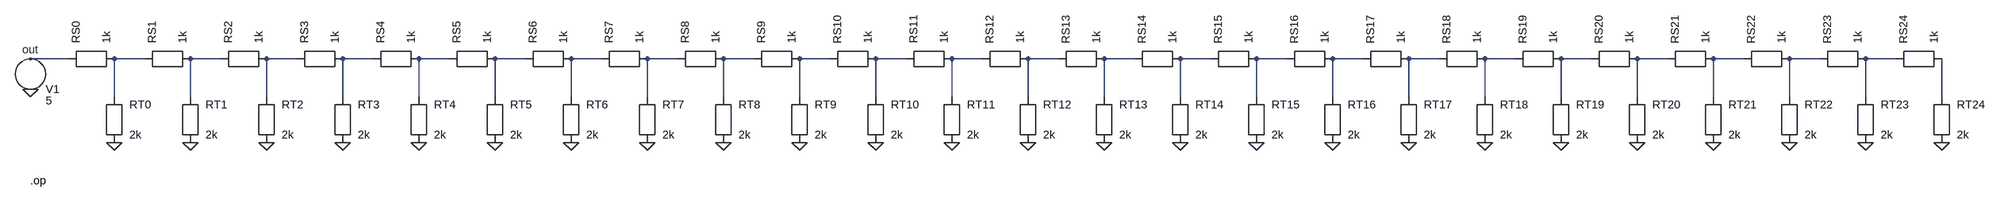
[diagram p0: schematic r2r_ladder_drawn.asc]
r2r_ladder_drawn.asc, the LTspice schematic file:
Version 4
SHEET 1 880 680
WIRE 96 96 176 96
WIRE 272 176 272 96
WIRE 272 96 336 96
WIRE 432 176 432 96
WIRE 432 96 496 96
WIRE 592 176 592 96
WIRE 592 96 656 96
WIRE 752 176 752 96
WIRE 752 96 816 96
WIRE 912 176 912 96
WIRE 912 96 976 96
WIRE 1072 176 1072 96
WIRE 1072 96 1136 96
WIRE 1232 176 1232 96
WIRE 1232 96 1296 96
WIRE 1392 176 1392 96
WIRE 1392 96 1456 96
WIRE 1552 176 1552 96
WIRE 1552 96 1616 96
WIRE 1712 176 1712 96
WIRE 1712 96 1776 96
WIRE 1872 176 1872 96
WIRE 1872 96 1936 96
WIRE 2032 176 2032 96
WIRE 2032 96 2096 96
WIRE 2192 176 2192 96
WIRE 2192 96 2256 96
WIRE 2352 176 2352 96
WIRE 2352 96 2416 96
WIRE 2512 176 2512 96
WIRE 2512 96 2576 96
WIRE 2672 176 2672 96
WIRE 2672 96 2736 96
WIRE 2832 176 2832 96
WIRE 2832 96 2896 96
WIRE 2992 176 2992 96
WIRE 2992 96 3056 96
WIRE 3152 176 3152 96
WIRE 3152 96 3216 96
WIRE 3312 176 3312 96
WIRE 3312 96 3376 96
WIRE 3472 176 3472 96
WIRE 3472 96 3536 96
WIRE 3632 176 3632 96
WIRE 3632 96 3696 96
WIRE 3792 176 3792 96
WIRE 3792 96 3856 96
WIRE 3952 176 3952 96
WIRE 3952 96 4016 96
WIRE 4112 176 4112 96
FLAG 96 96 out
FLAG 96 160 0
FLAG 272 272 0
FLAG 432 272 0
FLAG 592 272 0
FLAG 752 272 0
FLAG 912 272 0
FLAG 1072 272 0
FLAG 1232 272 0
FLAG 1392 272 0
FLAG 1552 272 0
FLAG 1712 272 0
FLAG 1872 272 0
FLAG 2032 272 0
FLAG 2192 272 0
FLAG 2352 272 0
FLAG 2512 272 0
FLAG 2672 272 0
FLAG 2832 272 0
FLAG 2992 272 0
FLAG 3152 272 0
FLAG 3312 272 0
FLAG 3472 272 0
FLAG 3632 272 0
FLAG 3792 272 0
FLAG 3952 272 0
FLAG 4112 272 0
SYMBOL voltage 96 128 R0
SYMATTR InstName V1
SYMATTR Value 5
SYMBOL res 224 96 R270
SYMATTR InstName RS0
SYMATTR Value 1k
SYMBOL res 272 224 R0
SYMATTR InstName RT0
SYMATTR Value 2k
SYMBOL res 384 96 R270
SYMATTR InstName RS1
SYMATTR Value 1k
SYMBOL res 432 224 R0
SYMATTR InstName RT1
SYMATTR Value 2k
SYMBOL res 544 96 R270
SYMATTR InstName RS2
SYMATTR Value 1k
SYMBOL res 592 224 R0
SYMATTR InstName RT2
SYMATTR Value 2k
SYMBOL res 704 96 R270
SYMATTR InstName RS3
SYMATTR Value 1k
SYMBOL res 752 224 R0
SYMATTR InstName RT3
SYMATTR Value 2k
SYMBOL res 864 96 R270
SYMATTR InstName RS4
SYMATTR Value 1k
SYMBOL res 912 224 R0
SYMATTR InstName RT4
SYMATTR Value 2k
SYMBOL res 1024 96 R270
SYMATTR InstName RS5
SYMATTR Value 1k
SYMBOL res 1072 224 R0
SYMATTR InstName RT5
SYMATTR Value 2k
SYMBOL res 1184 96 R270
SYMATTR InstName RS6
SYMATTR Value 1k
SYMBOL res 1232 224 R0
SYMATTR InstName RT6
SYMATTR Value 2k
SYMBOL res 1344 96 R270
SYMATTR InstName RS7
SYMATTR Value 1k
SYMBOL res 1392 224 R0
SYMATTR InstName RT7
SYMATTR Value 2k
SYMBOL res 1504 96 R270
SYMATTR InstName RS8
SYMATTR Value 1k
SYMBOL res 1552 224 R0
SYMATTR InstName RT8
SYMATTR Value 2k
SYMBOL res 1664 96 R270
SYMATTR InstName RS9
SYMATTR Value 1k
SYMBOL res 1712 224 R0
SYMATTR InstName RT9
SYMATTR Value 2k
SYMBOL res 1824 96 R270
SYMATTR InstName RS10
SYMATTR Value 1k
SYMBOL res 1872 224 R0
SYMATTR InstName RT10
SYMATTR Value 2k
SYMBOL res 1984 96 R270
SYMATTR InstName RS11
SYMATTR Value 1k
SYMBOL res 2032 224 R0
SYMATTR InstName RT11
SYMATTR Value 2k
SYMBOL res 2144 96 R270
SYMATTR InstName RS12
SYMATTR Value 1k
SYMBOL res 2192 224 R0
SYMATTR InstName RT12
SYMATTR Value 2k
SYMBOL res 2304 96 R270
SYMATTR InstName RS13
SYMATTR Value 1k
SYMBOL res 2352 224 R0
SYMATTR InstName RT13
SYMATTR Value 2k
SYMBOL res 2464 96 R270
SYMATTR InstName RS14
SYMATTR Value 1k
SYMBOL res 2512 224 R0
SYMATTR InstName RT14
SYMATTR Value 2k
SYMBOL res 2624 96 R270
SYMATTR InstName RS15
SYMATTR Value 1k
SYMBOL res 2672 224 R0
SYMATTR InstName RT15
SYMATTR Value 2k
SYMBOL res 2784 96 R270
SYMATTR InstName RS16
SYMATTR Value 1k
SYMBOL res 2832 224 R0
SYMATTR InstName RT16
SYMATTR Value 2k
SYMBOL res 2944 96 R270
SYMATTR InstName RS17
SYMATTR Value 1k
SYMBOL res 2992 224 R0
SYMATTR InstName RT17
SYMATTR Value 2k
SYMBOL res 3104 96 R270
SYMATTR InstName RS18
SYMATTR Value 1k
SYMBOL res 3152 224 R0
SYMATTR InstName RT18
SYMATTR Value 2k
SYMBOL res 3264 96 R270
SYMATTR InstName RS19
SYMATTR Value 1k
SYMBOL res 3312 224 R0
SYMATTR InstName RT19
SYMATTR Value 2k
SYMBOL res 3424 96 R270
SYMATTR InstName RS20
SYMATTR Value 1k
SYMBOL res 3472 224 R0
SYMATTR InstName RT20
SYMATTR Value 2k
SYMBOL res 3584 96 R270
SYMATTR InstName RS21
SYMATTR Value 1k
SYMBOL res 3632 224 R0
SYMATTR InstName RT21
SYMATTR Value 2k
SYMBOL res 3744 96 R270
SYMATTR InstName RS22
SYMATTR Value 1k
SYMBOL res 3792 224 R0
SYMATTR InstName RT22
SYMATTR Value 2k
SYMBOL res 3904 96 R270
SYMATTR InstName RS23
SYMATTR Value 1k
SYMBOL res 3952 224 R0
SYMATTR InstName RT23
SYMATTR Value 2k
SYMBOL res 4064 96 R270
SYMATTR InstName RS24
SYMATTR Value 1k
SYMBOL res 4112 224 R0
SYMATTR InstName RT24
SYMATTR Value 2k
TEXT 96 352 Left 2 !.op

The netlist it stands for:
* r2r_ladder_drawn.asc
V1 out 0 5
RS0 out N001 1k
RT0 N001 0 2k
RS1 N001 N002 1k
RT1 N002 0 2k
RS2 N002 N003 1k
RT2 N003 0 2k
RS3 N003 N004 1k
RT3 N004 0 2k
RS4 N004 N005 1k
RT4 N005 0 2k
RS5 N005 N006 1k
RT5 N006 0 2k
RS6 N006 N007 1k
RT6 N007 0 2k
RS7 N007 N008 1k
RT7 N008 0 2k
RS8 N008 N009 1k
RT8 N009 0 2k
RS9 N009 N010 1k
RT9 N010 0 2k
RS10 N010 N011 1k
RT10 N011 0 2k
RS11 N011 N012 1k
RT11 N012 0 2k
RS12 N012 N013 1k
RT12 N013 0 2k
RS13 N013 N014 1k
RT13 N014 0 2k
RS14 N014 N015 1k
RT14 N015 0 2k
RS15 N015 N016 1k
RT15 N016 0 2k
RS16 N016 N017 1k
RT16 N017 0 2k
RS17 N017 N018 1k
RT17 N018 0 2k
RS18 N018 N019 1k
RT18 N019 0 2k
RS19 N019 N020 1k
RT19 N020 0 2k
RS20 N020 N021 1k
RT20 N021 0 2k
RS21 N021 N022 1k
RT21 N022 0 2k
RS22 N022 N023 1k
RT22 N023 0 2k
RS23 N023 N024 1k
RT23 N024 0 2k
RS24 N024 N025 1k
RT24 N025 0 2k
.op
.backanno
.end